# Altium project PCB_PDB.PrjPcb
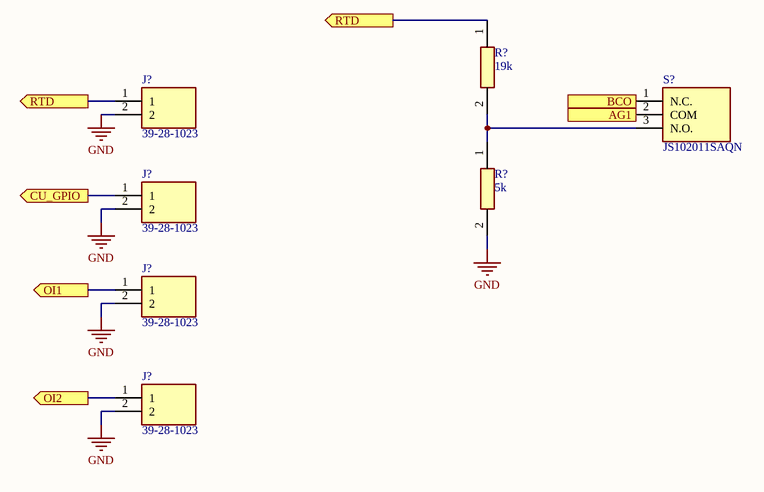
[diagram p0: Connectors.SchDoc]
4 sheets, 47 parts. Net scope: flat (ports and power ports of the same name join across sheets).
Sheets:
  Connectors.SchDoc
  Top_Level.SchDoc
  Relay_Driver.SchDoc
  Input_Circuit.SchDoc

## Sheet Connectors.SchDoc
size A; SheetNumber: 2; SheetTotal: 4

### Parts
(Parts that share a designator on the sheet are numbered #1, #2 ... from top to bottom, then left to right.)
J?#1  39-28-1023  [39-28-1023]
J?#2  39-28-1023  [39-28-1023]
J?#3  39-28-1023  [39-28-1023]
J?#4  39-28-1023  [39-28-1023]
R?#1  19k  [RESC5025X88N]
R?#2  5k  [RESC5025X88N]
S?  JS102011SAQN  [JS102011SAQN]

### Ports
AG1 (out), BCO (out), CU_GPIO (out), OI1 (out), OI2 (out), RTD (out)

### Nets
GND: J?#1.2 J?#2.2 J?#3.2 J?#4.2 R?#2.2
NetC?#1_1: S?.1(N.C.) ; port BCO
NetIC?#2_1: S?.2(COM) ; port AG1
NetJ?#1_1: J?#1.1 R?#1.1 ; port RTD
NetJ?#2_1: J?#2.1 ; port CU_GPIO
NetJ?#3_1: J?#3.1 ; port OI1
NetJ?#4_1: J?#4.1 ; port OI2
NetR?#1_2: R?#1.2 R?#2.1 S?.3(N.O.)

### Library data of the parts
J?#1-J?#4 = 39-28-1023: Connector; Manufacturer_Name: Molex; Datasheet Link: https://www.molex.com/pdm_docs/sd/039281023_sd.pdf; Height: 12.8mm; Manufacturer_Part_Number: 39-28-1023; Mouser Part Number: 538-39-28-1023; Mouser Price/Stock: https://www.mouser.co.uk/ProductDetail/Molex/39-28-1023?qs=LQQHZ4xw2XBykFU0jRHvlQ%3D%3D; Arrow Part Number: 39-28-1023; Arrow Price/Stock: https://www.arrow.com/en/products/39-28-1023/molex?region=nac
R?#1 R?#2 = WSL2010R2500FEA: Resistor; Manufacturer_Name: Vishay; Datasheet Link: http://componentsearchengine.com/Datasheets/1/WSL2010R2500FEA.pdf; Manufacturer_Part_Number: WSL2010R2500FEA; Mouser Part Number: 71-WSL2010R2500FEA; Mouser Price/Stock: https://www.mouser.co.uk/ProductDetail/Vishay-Dale/WSL2010R2500FEA?qs=IZrxGxQQvkPiYWdpItF4Pg%3D%3D; Arrow Part Number: WSL2010R2500FEA; Arrow Price/Stock: https://www.arrow.com/en/products/wsl2010r2500fea/vishay
S? = JS102011SAQN: Switch; Manufacturer_Name: LITTELFUSE; Datasheet Link: https://www.littelfuse.com/assetdocs/littelfuse-ck-slide-js-series-datasheet?assetguid=aba42b08-0d2c-423b-813d-a2faa5a3bb14; Height: 3.5mm; Manufacturer_Part_Number: JS102011SAQN; Mouser Part Number: 611-JS102011SAQN; Mouser Price/Stock: https://www.mouser.co.uk/ProductDetail/CK/JS102011SAQN?qs=LgMIjt8LuD%252B69bNM9a%2FozQ%3D%3D; Arrow Part Number: JS102011SAQN; Arrow Price/Stock: https://www.arrow.com/en/products/js102011saqn/littelfuse.html?utm_currency=USD&region=nac

## Sheet Top_Level.SchDoc
size A; SheetNumber: 1; SheetTotal: 1

## Sheet Relay_Driver.SchDoc
size A; SheetNumber: 3; SheetTotal: 4
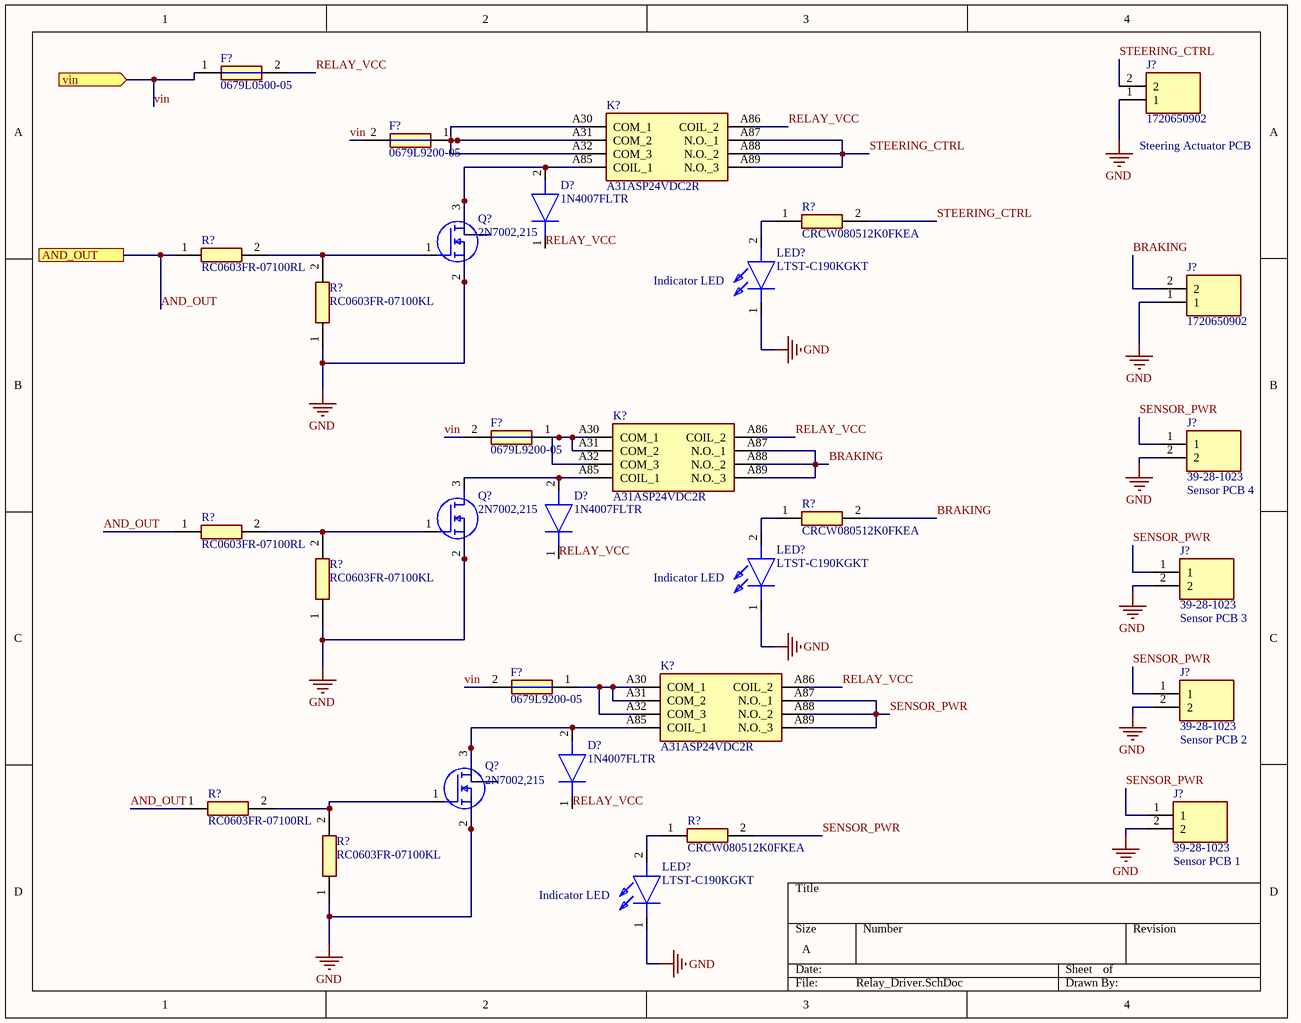
[diagram p1: Relay_Driver.SchDoc]

### Parts
(Parts that share a designator on the sheet are numbered #1, #2 ... from top to bottom, then left to right.)
D?#1  1N4007FLTR  [SODFL3718X140N]
D?#2  1N4007FLTR  [SODFL3718X140N]
D?#3  1N4007FLTR  [SODFL3718X140N]
F?#1  0679L0500-05  [FUSC6125X279N]
F?#2  0679L9200-05  [FUSC6125X279N]
F?#3  0679L9200-05  [FUSC6125X279N]
F?#4  0679L9200-05  [FUSC6125X279N]
J?#5  1720650902  [1720650902]
J?#6  1720650902  [1720650902]
J?#7  39-28-1023  [39-28-1023]
J?#8  39-28-1023  [39-28-1023]
J?#9  39-28-1023  [39-28-1023]
J?#10  39-28-1023  [39-28-1023]
K?#1  A31ASP24VDC2R  [A31ASP24VDC2R]
K?#2  A31ASP24VDC2R  [A31ASP24VDC2R]
K?#3  A31ASP24VDC2R  [A31ASP24VDC2R]
LED?#1  LTST-C190KGKT  [LEDC1608X80N]
LED?#2  LTST-C190KGKT  [LEDC1608X80N]
LED?#3  LTST-C190KGKT  [LEDC1608X80N]
Q?#1  2N7002,215  [SOT95P230X110-3N]
Q?#2  2N7002,215  [SOT95P230X110-3N]
Q?#3  2N7002,215  [SOT95P230X110-3N]
R?#3  CRCW080512K0FKEA  [RESC2012X50N]
R?#4  RC0603FR-07100RL  [RESC1608X55N]
R?#5  RC0603FR-07100KL  [RESC1608X55N]
R?#6  CRCW080512K0FKEA  [RESC2012X50N]
R?#7  RC0603FR-07100RL  [RESC1608X55N]
R?#8  RC0603FR-07100KL  [RESC1608X55N]
R?#9  RC0603FR-07100RL  [RESC1608X55N]
R?#10  CRCW080512K0FKEA  [RESC2012X50N]
R?#11  RC0603FR-07100KL  [RESC1608X55N]

### Ports
AND_OUT, vin (in)

### Nets
GND: J?#5.1 J?#6.1 J?#7.2 J?#8.2 J?#9.2 J?#10.2 LED?#1.1(K) LED?#2.1(K) LED?#3.1(K) Q?#1.2(S) Q?#2.2(S) Q?#3.2(S) R?#5.1 R?#8.1 R?#11.1
AND_OUT: R?#4.1 R?#7.1 R?#9.1 ; port AND_OUT
BRAKING: J?#6.2 K?#2.A87(N.O._1) K?#2.A88(N.O._2) K?#2.A89(N.O._3) R?#6.2
RELAY_VCC: D?#1.1(K) D?#2.1(K) D?#3.1(K) F?#1.2 K?#1.A86(COIL_2) K?#2.A86(COIL_2) K?#3.A86(COIL_2)
SENSOR_PWR: J?#7.1 J?#8.1 J?#9.1 J?#10.1 K?#3.A87(N.O._1) K?#3.A88(N.O._2) K?#3.A89(N.O._3) R?#10.2
STEERING_CTRL: J?#5.2 K?#1.A87(N.O._1) K?#1.A88(N.O._2) K?#1.A89(N.O._3) R?#3.2
vin: F?#1.1 F?#2.2 F?#3.2 F?#4.2 ; port vin
NetD?#1_2: D?#1.2(A) K?#1.A85(COIL_1) Q?#1.3(D)
NetD?#2_2: D?#2.2(A) K?#2.A85(COIL_1) Q?#2.3(D)
NetD?#3_2: D?#3.2(A) K?#3.A85(COIL_1) Q?#3.3(D)
NetF?#2_1: F?#2.1 K?#1.A30(COM_1) K?#1.A31(COM_2) K?#1.A32(COM_3)
NetF?#3_1: F?#3.1 K?#2.A30(COM_1) K?#2.A31(COM_2) K?#2.A32(COM_3)
NetF?#4_1: F?#4.1 K?#3.A30(COM_1) K?#3.A31(COM_2) K?#3.A32(COM_3)
NetLED?#1_2: LED?#1.2(A) R?#3.1
NetLED?#2_2: LED?#2.2(A) R?#6.1
NetLED?#3_2: LED?#3.2(A) R?#10.1
NetQ?#1_1: Q?#1.1(G) R?#4.2 R?#5.2
NetQ?#2_1: Q?#2.1(G) R?#7.2 R?#8.2
NetQ?#3_1: Q?#3.1(G) R?#9.2 R?#11.2

### Notes on the sheet
- (near J?#5) Steering Actuator PCB
- (near LED?#1) Indicator LED
- (near J?#7) Sensor PCB 4
- (near LED?#2) Indicator LED
- (near J?#8) Sensor PCB 3
- (near J?#9) Sensor PCB 2
- (near LED?#3) Indicator LED
- (near J?#10) Sensor PCB 1

### Library data of the parts
D?#1-D?#3 = 1N4007FLTR: Diode; Manufacturer_Name: SMC Diode Solutions; Datasheet Link: http://www.smc-diodes.com/propdf/1N4001FL-1N4007FL%20N1646%20REV.A.pdf; Height: 1.4mm; Manufacturer_Part_Number: 1N4007FLTR
F?#1 = 0679L0500-05: Fuse; Manufacturer_Name: Bel Circuit Protection; Datasheet Link: https://au.mouser.com/datasheet/2/643/ds_cp_0679l_series-1291227.pdf; Height: 2.79mm; Manufacturer_Part_Number: 0679L0500-05; Arrow Part Number: 0679L0500-05; Arrow Price/Stock: https://www.arrow.com/en/products/0679l0500-05/bel-group
F?#2-F?#4 = 0679L9200-05: Fuse; Manufacturer_Name: BelFuse; Datasheet Link: https://mouser.componentsearchengine.com/Datasheets/1/0679L9200-05.pdf; Height: 2.79mm; Manufacturer_Part_Number: 0679L9200-05; Mouser Part Number: 530-0679L9200-05; Mouser Price/Stock: https://www.mouser.co.uk/ProductDetail/Bel-Fuse/0679L9200-05?qs=ZqXcJfGlKsjLkLjgIYVYTw%3D%3D; Arrow Part Number: 0679L9200-05; Arrow Price/Stock: https://www.arrow.com/en/products/0679l9200-05/bel-group
J?#5 J?#6 = 1720650902: Connector; Manufacturer_Name: Molex; Datasheet Link: https://www.molex.com/content/dam/molex/molex-dot-com/products/automated/en-us/salesdrawingpdf/172/172065/1720650902_sd.pdf; Height: 15.2mm; Manufacturer_Part_Number: 1720650902
J?#7-J?#10 = 39-28-1023: Connector; Manufacturer_Name: Molex; Datasheet Link: https://www.molex.com/pdm_docs/sd/039281023_sd.pdf; Height: 12.8mm; Manufacturer_Part_Number: 39-28-1023; Mouser Part Number: 538-39-28-1023; Mouser Price/Stock: https://www.mouser.co.uk/ProductDetail/Molex/39-28-1023?qs=LQQHZ4xw2XBykFU0jRHvlQ%3D%3D; Arrow Part Number: 39-28-1023; Arrow Price/Stock: https://www.arrow.com/en/products/39-28-1023/molex?region=nac
K?#1-K?#3 = A31ASP24VDC2R: Relay or Contactor; Manufacturer_Name: CIT Relay & Switch; Datasheet Link: https://www.citrelay.com/CatalogPages/RelayCatalog/A3.pdf; Height: 27.55mm; Manufacturer_Part_Number: A31ASP24VDC2R
LED?#1-LED?#3 = LTST-C190KGKT: LED; Manufacturer_Name: Lite-On; Datasheet Link: http://uk.rs-online.com/web/p/visible-leds/6920988/; Height: 0.8mm; Manufacturer_Part_Number: LTST-C190KGKT; Mouser Part Number: 859-LTST-C190KGKT; Mouser Price/Stock: https://www.mouser.co.uk/ProductDetail/Lite-On/LTST-C190KGKT?qs=205qCy6M2Q%252BAdcgwUZktqw%3D%3D; Arrow Part Number: LTST-C190KGKT; Arrow Price/Stock: https://www.arrow.com/en/products/ltst-c190kgkt/lite-on-technology.html?utm_currency=USD&region=europe
Q?#1-Q?#3 = 2N7002,215: MOSFET (N-Channel); Manufacturer_Name: Nexperia; Datasheet Link: https://assets.nexperia.com/documents/data-sheet/2N7002.pdf; Height: 1.1mm; Manufacturer_Part_Number: 2N7002,215; Mouser Part Number: 771-2N7002-T/R; Mouser Price/Stock: https://www.mouser.co.uk/ProductDetail/Nexperia/2N7002215?qs=P62ublwmbi9rRKKuNdhqMA%3D%3D; Arrow Part Number: 2N7002,215; Arrow Price/Stock: https://www.arrow.com/en/products/2n7002215/nexperia?utm_currency=USD&region=nac
R?#3 R?#6 R?#10 = CRCW080512K0FKEA: Resistor; Manufacturer_Name: Vishay; Datasheet Link: http://www.vishay.com/docs/20035/dcrcwe3.pdf; Height: 0.5mm; Manufacturer_Part_Number: CRCW080512K0FKEA; Mouser Part Number: 71-CRCW080512K0FKEA; Mouser Price/Stock: https://www.mouser.co.uk/ProductDetail/Vishay-Dale/CRCW080512K0FKEA?qs=0y7Riw94L4gQIm4gt5oa2A%3D%3D; Arrow Part Number: CRCW080512K0FKEA; Arrow Price/Stock: https://www.arrow.com/en/products/crcw080512k0fkea/vishay?region=europe
R?#4 R?#7 R?#9 = RC0603FR-07100RL: Resistor; Manufacturer_Name: Yageo Group; Datasheet Link: http://www.yageo.com/documents/recent/PYu-RC0603_51_RoHS_L_v5.pdf; Height: 0.55mm; Manufacturer_Part_Number: RC0603FR-07100RL; Mouser Part Number: 603-RC0603FR-07100RL; Mouser Price/Stock: https://www.mouser.co.uk/ProductDetail/YAGEO/RC0603FR-07100RL?qs=NEN%2FsE%2FLsvPIwIWKCOS4%2FA%3D%3D; Arrow Part Number: RC0603FR-07100RL; Arrow Price/Stock: https://www.arrow.com/en/products/rc0603fr-07100rl/yageo.html?utm_currency=USD&region=nac
R?#5 R?#8 R?#11 = RC0603FR-07100KL: Resistor; Manufacturer_Name: Yageo Group; Datasheet Link: https://www.yageo.com/upload/media/product/productsearch/datasheet/rchip/PYu-RC_Group_51_RoHS_L_12.pdf; Height: 0.55mm; Manufacturer_Part_Number: RC0603FR-07100KL; Mouser Part Number: 603-RC0603FR-07100KL; Mouser Price/Stock: https://www.mouser.co.uk/ProductDetail/YAGEO/RC0603FR-07100KL?qs=e1ok2LiJcmaihem8Va5%2Fsw%3D%3D; Arrow Part Number: RC0603FR-07100KL; Arrow Price/Stock: https://www.arrow.com/en/products/rc0603fr-07100kl/yageo.html?utm_currency=USD&region=europe

## Sheet Input_Circuit.SchDoc
size B; SheetNumber: 1; SheetTotal: 4
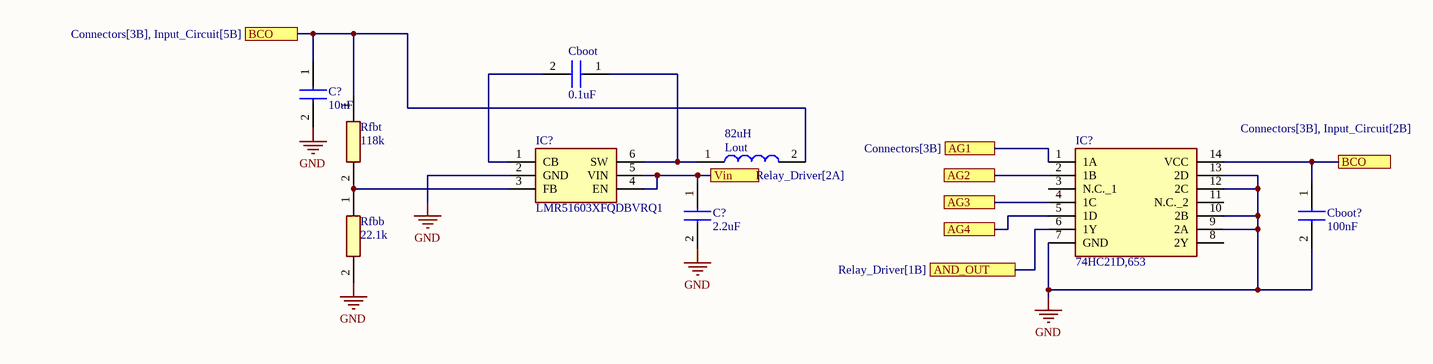
[diagram p2: Input_Circuit.SchDoc]

### Parts
(Parts that share a designator on the sheet are numbered #1, #2 ... from top to bottom, then left to right.)
C?#1  10uF  [CAPC3216X180N]
C?#2  2.2uF  [CAPC3216X180N]
Cboot  0.1uF  [CAPC3216X180N]
Cboot?  100nF  [CAPC3216X180N]
IC?#1  LMR51603XFQDBVRQ1  [SOT95P280X145-6N]
IC?#2  74HC21D,653  [SOIC127P600X175-14N]
Lout  82uH  [INDPM120120X805N]
Rfbb  22.1k  [RESC2012X65N]
Rfbt  118k  [RESC2012X65N]

### Ports
AG1 (see Connectors[3B]), AG2, AG3, AG4, AND_OUT (see Relay_Driver[1B]), BCO (see Connectors[3B], Input_Circuit[2B]), BCO (see Connectors[3B], Input_Circuit[5B]), Vin (see Relay_Driver[2A])

### Nets
GND: C?#1.2 C?#2.2 Cboot?.2 IC?#1.2(GND) IC?#2.7(GND) IC?#2.9(2A) IC?#2.10(2B) IC?#2.12(2C) IC?#2.13(2D) Rfbb.2
AND_OUT: IC?#2.6(1Y) ; port AND_OUT
vin: C?#2.1 IC?#1.4(EN) IC?#1.5(VIN) ; port Vin
NetC?#1_1: C?#1.1 Cboot?.1 IC?#2.14(VCC) Lout.2 Rfbt.1 ; port BCO
NetCboot_1: Cboot.1 IC?#1.6(SW) Lout.1
NetCboot_2: Cboot.2 IC?#1.1(CB)
NetIC?#1_3: IC?#1.3(FB) Rfbb.1 Rfbt.2
NetIC?#2_1: IC?#2.1(1A) ; port AG1
NetIC?#2_2: IC?#2.2(1B) ; port AG2
NetIC?#2_4: IC?#2.4(1C) ; port AG3
NetIC?#2_5: IC?#2.5(1D) ; port AG4

Not connected (* = marked no-connect by the designer): IC?#2 3(N.C._1) 8(2Y) 11(N.C._2)

### Library data of the parts
C?#1 C?#2 Cboot Cboot? = CL31B106KBHNNNE: Capacitor; Manufacturer_Name: SAMSUNG; Datasheet Link: https://datasheet.datasheetarchive.com/originals/distributors/DKDS-19/375194.pdf; Height: 1.8mm; Manufacturer_Part_Number: CL31B106KBHNNNE; Mouser Part Number: 187-CL31B106KBHNNNE; Mouser Price/Stock: https://www.mouser.co.uk/ProductDetail/Samsung-Electro-Mechanics/CL31B106KBHNNNE?qs=T0XSgvH75d4ZN8WrMi8xmQ%3D%3D; Arrow Part Number: CL31B106KBHNNNE; Arrow Price/Stock: https://www.arrow.com/en/products/cl31b106kbhnnne/samsung-electro-mechanics.html?utm_currency=USD&region=nac
IC?#1 = LMR51603XFQDBVRQ1: Integrated Circuit; Manufacturer_Name: Texas Instruments; Datasheet Link: https://www.ti.com/lit/gpn/lmr51603-q1; Height: 1.45mm; Manufacturer_Part_Number: LMR51603XFQDBVRQ1; Mouser Part Number: 595-LMR51603XFQDBRQ1; Mouser Price/Stock: https://www.mouser.co.uk/ProductDetail/Texas-Instruments/LMR51603XFQDBVRQ1?qs=olJun0bQHM9FozH0oybAow%3D%3D; Arrow Part Number: LMR51603XFQDBVRQ1; Arrow Price/Stock: https://www.arrow.com/en/products/lmr51603xfqdbvrq1/texas-instruments.html?utm_currency=USD&region=nac
IC?#2 = 74HC21D,653: Integrated Circuit; Manufacturer_Name: Nexperia; Datasheet Link: https://assets.nexperia.com/documents/data-sheet/74HC21.pdf; Height: 1.75mm; Manufacturer_Part_Number: 74HC21D,653; Mouser Part Number: 771-74HC21D-T; Mouser Price/Stock: https://www.mouser.co.uk/ProductDetail/Nexperia/74HC21D653?qs=P62ublwmbi95sLgvsDo8LA%3D%3D; Arrow Part Number: 74HC21D,653; Arrow Price/Stock: https://www.arrow.com/en/products/74hc21d653/nexperia.html?utm_currency=USD&region=asia
Lout = MSS1278-333MLD: Inductor; Manufacturer_Name: COILCRAFT; Datasheet Link: https://www.coilcraft.com/pdfs/mss1278.pdf; Height: 8.05mm; Manufacturer_Part_Number: MSS1278-333MLD; Mouser Part Number: 994-MSS1278-333MLD; Mouser Price/Stock: https://www.mouser.co.uk/ProductDetail/Coilcraft/MSS1278-333MLD?qs=zCSbvcPd3pbln1ZLcloB%252BQ%3D%3D
Rfbb Rfbt = RMCF0805FT10K0: Resistor; Manufacturer_Name: Stackpole Electronics; Datasheet Link: https://www.seielect.com/catalog/sei-rmcf_rmcp.pdf; Height: 0.65mm; Manufacturer_Part_Number: RMCF0805FT10K0; Mouser Part Number: 708-RMCF0805FT10K0; Mouser Price/Stock: https://www.mouser.co.uk/ProductDetail/SEI-Stackpole/RMCF0805FT10K0?qs=IreZ0J%252BReG3LOHc8zdDe6Q%3D%3D; Arrow Part Number: RMCF0805FT10K0; Arrow Price/Stock: https://www.arrow.com/en/products/rmcf0805ft10k0/stackpole-electronics?region=nac

## Nets that join several sheets
GND: Connectors (5 pins), Relay_Driver (15 pins), Input_Circuit (10 pins)
AND_OUT: Relay_Driver (R?#4.1 R?#7.1 R?#9.1), Input_Circuit (IC?#2.6)
NetC?#1_1: Connectors (S?.1), Input_Circuit (5 pins)
NetIC?#2_1: Connectors (S?.2), Input_Circuit (IC?#2.1)
vin: Relay_Driver (F?#1.1 F?#2.2 F?#3.2 F?#4.2), Input_Circuit (C?#2.1 IC?#1.4 IC?#1.5)